# Altium project GIGA R1 WiFi.PrjPcb (part 2 of 2)

## Sheet HEADERS.SchDoc: HEADERS
size A3; Author: Silvio Navaretti; CompanyName: Arduino srl; DocumentNumber: ABX00063; Revision: V1.2; SheetNumber: 2; SheetTotal: 8; RevAuthor: Silvio Navaretti
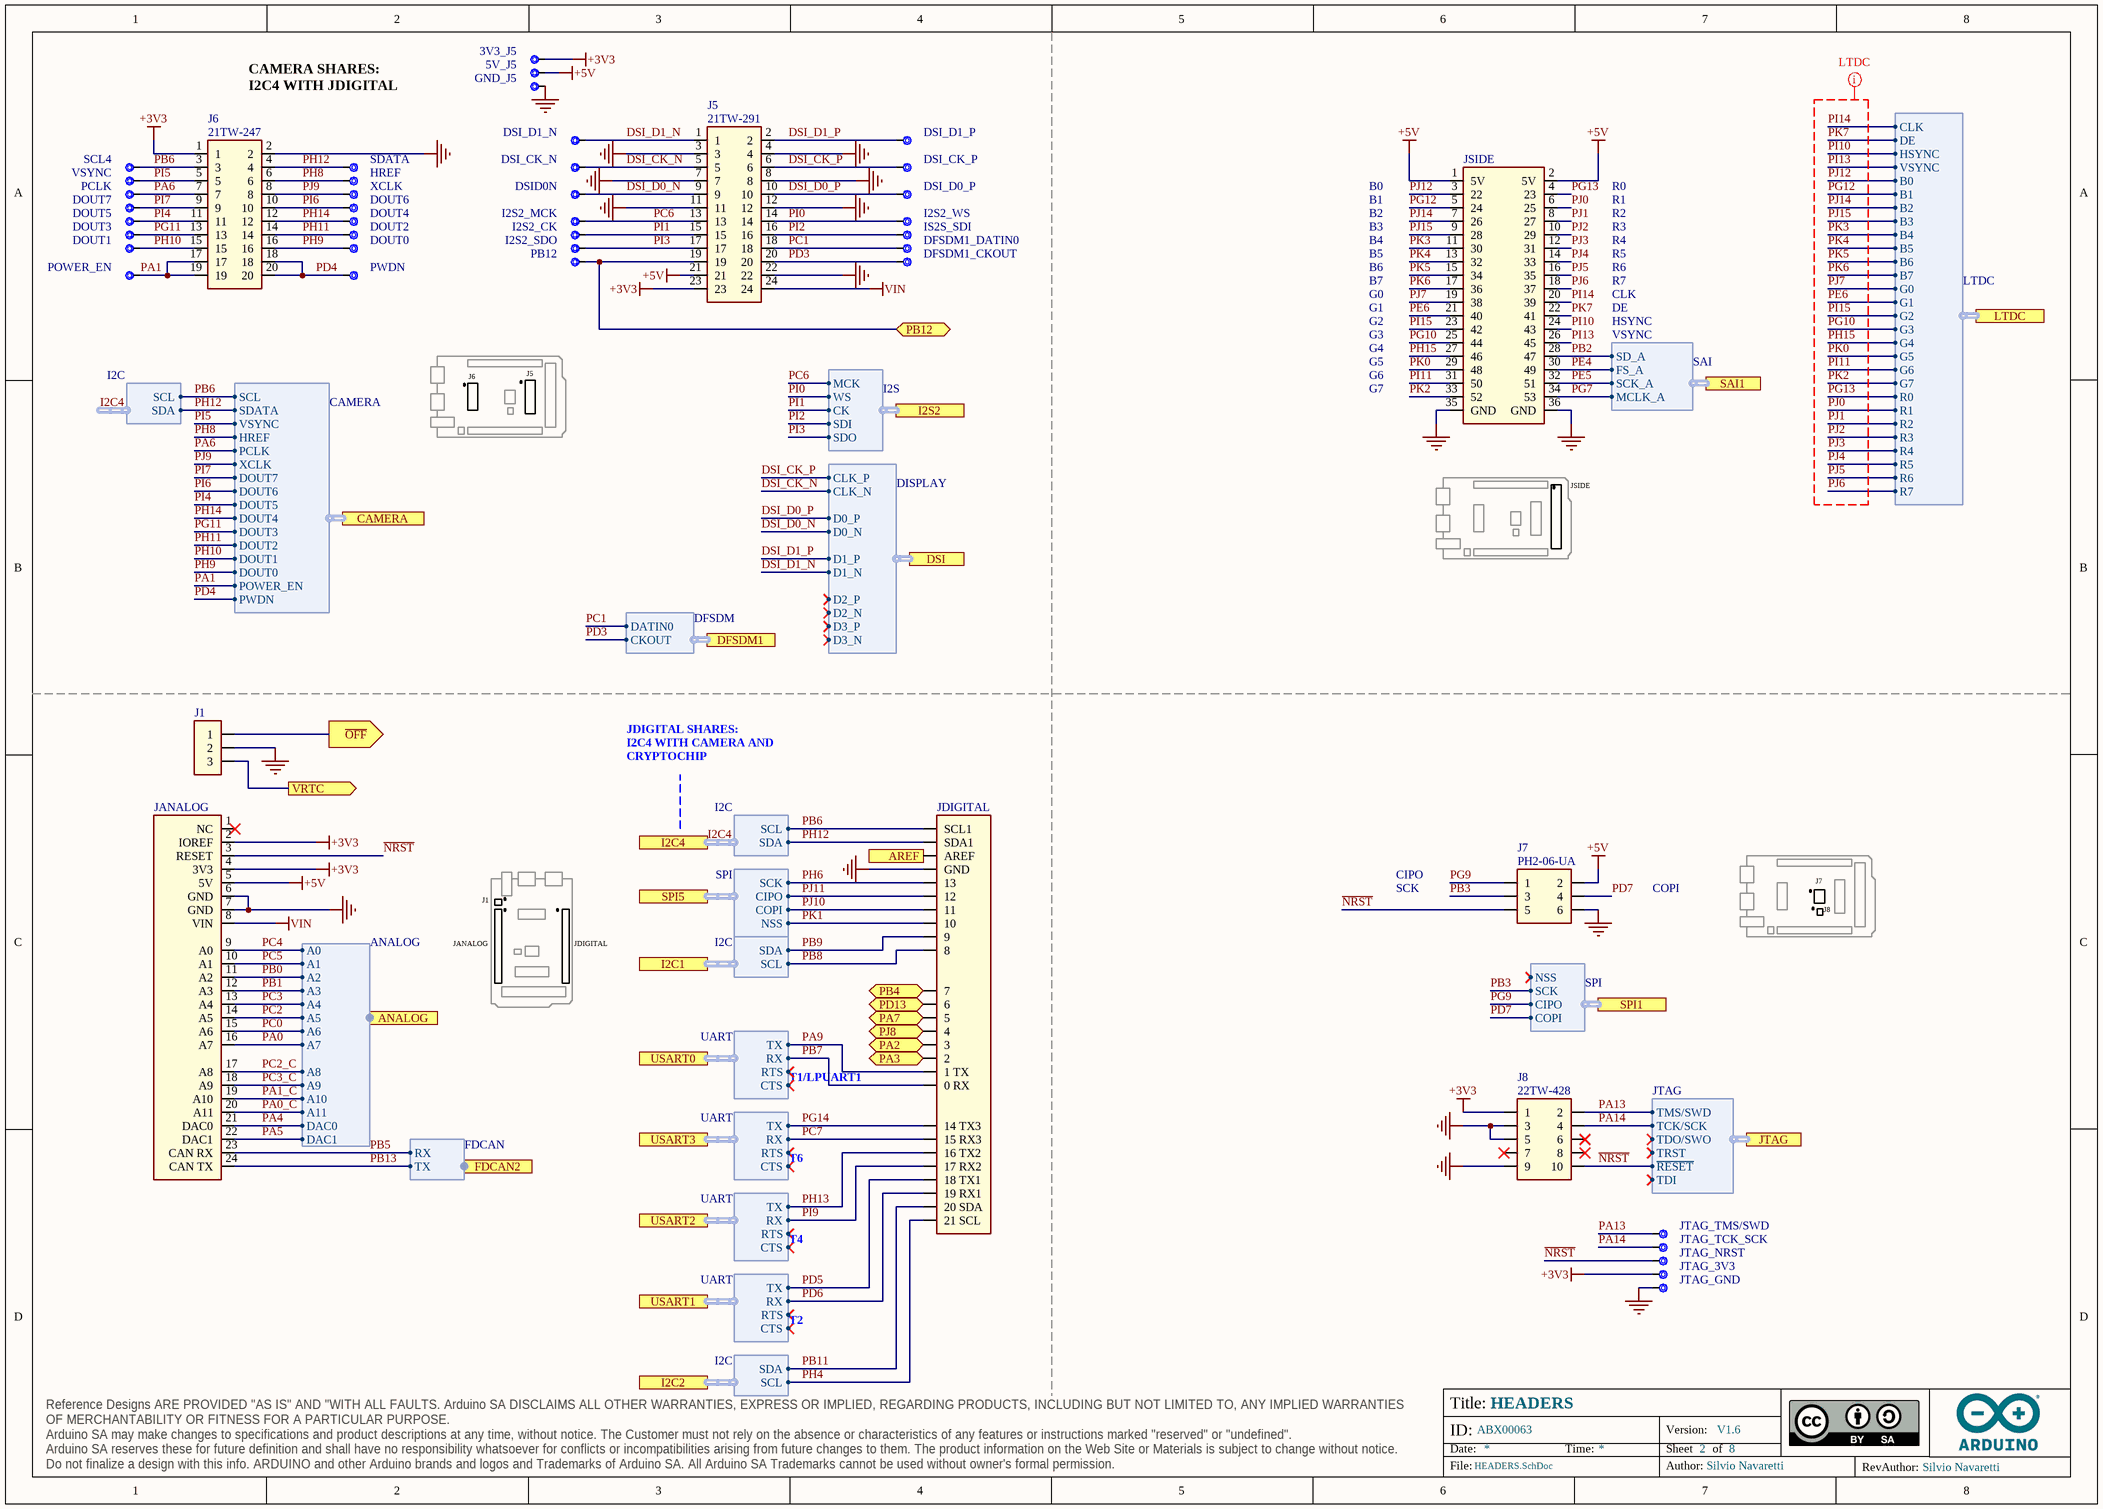
[diagram p5: HEADERS.SchDoc]

### Parts
3V3_J5  CMP-018-0005-A.3  [TP-1.00MM]  (value not drawn)  (no BOM)
5V_J5  CMP-018-0005-A.3  [TP-1.00MM]  (value not drawn)  (no BOM)
DFSDM1_CKOUT  CMP-018-0005-A.3  [TP-1.00MM]  (value not drawn)  (no BOM)
DFSDM1_DATIN0  CMP-018-0005-A.3  [TP-1.00MM]  (value not drawn)  (no BOM)
DOUT0  CMP-018-0005-A.3  [TP-1.00MM]  (value not drawn)  (no BOM)
DOUT1  CMP-018-0005-A.3  [TP-1.00MM]  (value not drawn)  (no BOM)
DOUT2  CMP-018-0005-A.3  [TP-1.00MM]  (value not drawn)  (no BOM)
DOUT3  CMP-018-0005-A.3  [TP-1.00MM]  (value not drawn)  (no BOM)
DOUT4  CMP-018-0005-A.3  [TP-1.00MM]  (value not drawn)  (no BOM)
DOUT5  CMP-018-0005-A.3  [TP-1.00MM]  (value not drawn)  (no BOM)
DOUT6  CMP-018-0005-A.3  [TP-1.00MM]  (value not drawn)  (no BOM)
DOUT7  CMP-018-0005-A.3  [TP-1.00MM]  (value not drawn)  (no BOM)
DSI_CK_N  CMP-018-0005-A.3  [TP-1.00MM]  (value not drawn)  (no BOM)
DSI_CK_P  CMP-018-0005-A.3  [TP-1.00MM]  (value not drawn)  (no BOM)
DSI_D0_P  CMP-018-0005-A.3  [TP-1.00MM]  (value not drawn)  (no BOM)
DSI_D1_N  CMP-018-0005-A.3  [TP-1.00MM]  (value not drawn)  (no BOM)
DSI_D1_P  CMP-018-0005-A.3  [TP-1.00MM]  (value not drawn)  (no BOM)
DSID0N  CMP-018-0005-A.3  [TP-1.00MM]  (value not drawn)  (no BOM)
GND_J5  CMP-018-0005-A.3  [TP-1.00MM]  (value not drawn)  (no BOM)
HREF  CMP-018-0005-A.3  [TP-1.00MM]  (value not drawn)  (no BOM)
I2S2_CK  CMP-018-0005-A.3  [TP-1.00MM]  (value not drawn)  (no BOM)
I2S2_MCK  CMP-018-0005-A.3  [TP-1.00MM]  (value not drawn)  (no BOM)
I2S2_SDO  CMP-018-0005-A.3  [TP-1.00MM]  (value not drawn)  (no BOM)
I2S2_WS  CMP-018-0005-A.3  [TP-1.00MM]  (value not drawn)  (no BOM)
IS2S_SDI  CMP-018-0005-A.3  [TP-1.00MM]  (value not drawn)  (no BOM)
J1  HEADER TH 2.54mm VERT. 1x003POS  [PIN HEADER 2.54mm VERT. 1x3POS]  (value not drawn)  (no BOM)
J5  21TW-291  [21TW-291]
J6  21TW-247  [21TW-247]
J7  PH2-06-UA  [2X03]
J8  22TW-428  [FTSH-105-01-F-DV-Footprint-1]
JANALOG  20TW-887  [GIGA header custom analog]  (value not drawn)
JDIGITAL  20TW-890  [GIGA Header custom digital]  (value not drawn)
JSIDE  20TW-891  [GIGA custom header side-Footprint-1]  (value not drawn)
JTAG_3V3  CMP-018-0005-A.3  [TP-1.00MM]  (value not drawn)  (no BOM)
JTAG_GND  CMP-018-0005-A.3  [TP-1.00MM]  (value not drawn)  (no BOM)
JTAG_NRST  CMP-018-0005-A.3  [TP-1.00MM]  (value not drawn)  (no BOM)
JTAG_TCK_SCK  CMP-018-0005-A.3  [TP-1.00MM]  (value not drawn)  (no BOM)
JTAG_TMS/SWD  CMP-018-0005-A.3  [TP-1.00MM]  (value not drawn)  (no BOM)
PB12  CMP-018-0005-A.3  [TP-1.00MM]  (value not drawn)  (no BOM)
PCLK  CMP-018-0005-A.3  [TP-1.00MM]  (value not drawn)  (no BOM)
POWER_EN  CMP-018-0005-A.3  [TP-1.00MM]  (value not drawn)  (no BOM)
PWDN  CMP-018-0005-A.3  [TP-1.00MM]  (value not drawn)  (no BOM)
SCL4  CMP-018-0005-A.3  [TP-1.00MM]  (value not drawn)  (no BOM)
SDATA  CMP-018-0005-A.3  [TP-1.00MM]  (value not drawn)  (no BOM)
VSYNC  CMP-018-0005-A.3  [TP-1.00MM]  (value not drawn)  (no BOM)
XCLK  CMP-018-0005-A.3  [TP-1.00MM]  (value not drawn)  (no BOM)

### Ports
ANALOG (harness ANALOG), AREF (out), CAMERA (harness CAMERA), DFSDM1 (harness DFSDM), DSI (harness DISPLAY), FDCAN2 (harness FDCAN), I2C1 (harness I2C), I2C2 (harness I2C), I2C4 (harness I2C), I2S2 (harness I2S), JTAG (harness JTAG), LTDC (harness LTDC), PA2 (bidir), PA3 (bidir), PA7 (bidir), PB4 (bidir), PB12 (bidir), PD13 (bidir), PJ8 (bidir), SAI1 (harness SAI), SPI1 (harness SPI), SPI5 (harness SPI), USART0 (harness UART), USART1 (harness UART), USART2 (harness UART), USART3 (harness UART), VRTC (out), ~{OFF} (out)

### Harnesses
SPI: NSS, SCK, CIPO, COPI
I2C: SDA, SCL
LTDC: B0, B1, B2, B3, B4, B5, B6, B7, CLK, DE, G0, G1, G2, G3, G4, G5, G6, G7, HSYNC, R0, R1, R2, R3, R4, R5, R6, R7, VSYNC
SAI: SD_A, FS_A, SCK_A, MCLK_A
ANALOG: A0, A1, A2, A3, A7, A6, A5, A4, A8, A9, A10, A11, DAC0, DAC1
I2S: CK, SDI, SDO, WS, MCK
DISPLAY: CLK_N, CLK_P, D0_N, D0_P, D1_N, D1_P, D2_N, D2_P, D3_N, D3_P
DFSDM: DATIN0, CKOUT
CAMERA: SCL, SDATA, VSYNC, HREF, PCLK, XCLK, DOUT7, DOUT6, DOUT5, DOUT4, DOUT3, DOUT2, DOUT1, DOUT0, POWER_EN, PWDN
JTAG: ~{RESET}, TCK/SCK, TDI, TDO/SWO, TMS/SWD, TRST
UART: RX, TX, RTS, CTS
FDCAN: RX, TX

### Nets
+3V3: 3V3_J5.X J5.23 J6.1 J8.1 JANALOG.2(IOREF) JANALOG.4(3V3) JTAG_3V3.X
+5V: 5V_J5.X J5.21 J7.2 JANALOG.5(5V) JSIDE.1(5V) JSIDE.2(5V)
GND: GND_J5.X J1.2 J5.3 J5.4 J5.7 J5.8 J5.11 J5.12 J5.22 J6.2 J7.6 J8.3 J8.5 J8.9 JANALOG.6(GND) JANALOG.7(GND) JDIGITAL.4(GND) JSIDE.35(GND) JSIDE.36(GND) JTAG_GND.X
VIN: J5.24 JANALOG.8(VIN)
DSI_CK_N: DSI_CK_N.X J5.5 ; port DSI.CLK_N
DSI_CK_P: DSI_CK_P.X J5.6 ; port DSI.CLK_P
DSI_D0_N: DSID0N.X J5.9 ; port DSI.D0_N
DSI_D0_P: DSI_D0_P.X J5.10 ; port DSI.D0_P
DSI_D1_N: DSI_D1_N.X J5.1 ; port DSI.D1_N
DSI_D1_P: DSI_D1_P.X J5.2 ; port DSI.D1_P
~{NRST}: J7.5 J8.10 JANALOG.3(RESET) JTAG_NRST.X ; port JTAG.~{RESET}  [project net JTAG.~{RESET}]
PA0: JANALOG.16(A7) ; port ANALOG.A7  [project net MIC]
PA0_C: JANALOG.20(A11) ; port ANALOG.A11
PA1: J6.17 J6.19 POWER_EN.X ; port CAMERA.POWER_EN
PA1_C: JANALOG.19(A10) ; port ANALOG.A10
PA2: JDIGITAL.15(3) ; port PA2
PA3: JDIGITAL.16(2) ; port PA3
PA4: JANALOG.21(DAC0) ; port ANALOG.DAC0
PA5: JANALOG.22(DAC1) ; port ANALOG.DAC1  [project net LEFT]
PA6: J6.7 PCLK.X ; port CAMERA.PCLK
PA7: JDIGITAL.13(5) ; port PA7
PA9: JDIGITAL.17(1_TX) ; port USART0.TX
PA13: J8.2 JTAG_TMS/SWD.X ; port JTAG.TMS/SWD  [project net JTAG.TMS/SWD]
PA14: J8.4 JTAG_TCK_SCK.X ; port JTAG.TCK/SCK  [project net JTAG.TCK/SCK]
PB0: JANALOG.11(A2) ; port ANALOG.A2
PB1: JANALOG.12(A3) ; port ANALOG.A3
PB2: JSIDE.28(47) ; port SAI1.SD_A
PB3: J7.3 ; port SPI1.SCK
PB4: JDIGITAL.11(7) ; port PB4
PB5: JANALOG.23(CAN_RX) ; port FDCAN2.RX
PB6: J6.3 JDIGITAL.1(SCL1) SCL4.X ; port CAMERA.SCL, port I2C4.SCL  [project net I2C4.SCL]
PB7: JDIGITAL.18(0_RX) ; port USART0.RX
PB8: JDIGITAL.10(8) ; port I2C1.SCL
PB9: JDIGITAL.9 ; port I2C1.SDA
PB11: JDIGITAL.25(20_SDA) ; port I2C2.SDA
PB12: J5.19 PB12.X ; port PB12
PB13: JANALOG.24(CAN_TX) ; port FDCAN2.TX
PC0: JANALOG.15(A6) ; port ANALOG.A6
PC1: DFSDM1_DATIN0.X J5.18 ; port DFSDM1.DATIN0
PC2: JANALOG.14(A5) ; port ANALOG.A5
PC2_C: JANALOG.17(A8) ; port ANALOG.A8
PC3: JANALOG.13(A4) ; port ANALOG.A4
PC3_C: JANALOG.18(A9) ; port ANALOG.A9
PC4: JANALOG.9(A0) ; port ANALOG.A0
PC5: JANALOG.10(A1) ; port ANALOG.A1
PC6: I2S2_MCK.X J5.13 ; port I2S2.MCK
PC7: JDIGITAL.20(15_RX3) ; port USART3.RX
PD3: DFSDM1_CKOUT.X J5.20 ; port DFSDM1.CKOUT
PD4: J6.18 J6.20 PWDN.X ; port CAMERA.PWDN
PD5: JDIGITAL.23(18_TX1) ; port USART1.TX
PD6: JDIGITAL.24(19_RX1) ; port USART1.RX
PD7: J7.4 ; port SPI1.COPI
PD13: JDIGITAL.12(6) ; port PD13
PE4: JSIDE.30(49) ; port SAI1.FS_A
PE5: JSIDE.32(51) ; port SAI1.SCK_A
PE6: JSIDE.21(40) ; port LTDC.G1
PG7: JSIDE.34(53) ; port SAI1.MCLK_A
PG9: J7.1 ; port SPI1.CIPO
PG10: JSIDE.25(44) ; port LTDC.G3
PG11: DOUT3.X J6.13 ; port CAMERA.DOUT3
PG12: JSIDE.5(24) ; port LTDC.B1
PG13: JSIDE.4(23) ; port LTDC.R0
PG14: JDIGITAL.19(14_TX3) ; port USART3.TX
PH4: JDIGITAL.26(21_SCL) ; port I2C2.SCL
PH6: JDIGITAL.5(13) ; port SPI5.SCK
PH8: HREF.X J6.6 ; port CAMERA.HREF
PH9: DOUT0.X J6.16 ; port CAMERA.DOUT0
PH10: DOUT1.X J6.15 ; port CAMERA.DOUT1
PH11: DOUT2.X J6.14 ; port CAMERA.DOUT2
PH12: J6.4 JDIGITAL.2(SDA1) SDATA.X ; port CAMERA.SDATA, port I2C4.SDA  [project net I2C4.SDA]
PH13: JDIGITAL.21(16_TX2) ; port USART2.TX
PH14: DOUT4.X J6.12 ; port CAMERA.DOUT4
PH15: JSIDE.27(46) ; port LTDC.G4
PI0: I2S2_WS.X J5.14 ; port I2S2.WS
PI1: I2S2_CK.X J5.15 ; port I2S2.CK
PI2: IS2S_SDI.X J5.16 ; port I2S2.SDI
PI3: I2S2_SDO.X J5.17 ; port I2S2.SDO
PI4: DOUT5.X J6.11 ; port CAMERA.DOUT5
PI5: J6.5 VSYNC.X ; port CAMERA.VSYNC
PI6: DOUT6.X J6.10 ; port CAMERA.DOUT6
PI7: DOUT7.X J6.9 ; port CAMERA.DOUT7
PI9: JDIGITAL.22(17_RX2) ; port USART2.RX
PI10: JSIDE.24(43) ; port LTDC.HSYNC
PI11: JSIDE.31(50) ; port LTDC.G6
PI13: JSIDE.26(45) ; port LTDC.VSYNC
PI14: JSIDE.20(39) ; port LTDC.CLK
PI15: JSIDE.23(42) ; port LTDC.G2
PJ0: JSIDE.6(25) ; port LTDC.R1
PJ1: JSIDE.8(27) ; port LTDC.R2
PJ2: JSIDE.10(29) ; port LTDC.R3
PJ3: JSIDE.12(31) ; port LTDC.R4
PJ4: JSIDE.14(33) ; port LTDC.R5
PJ5: JSIDE.16(35) ; port LTDC.R6
PJ6: JSIDE.18(37) ; port LTDC.R7
PJ7: JSIDE.19(38) ; port LTDC.G0
PJ8: JDIGITAL.14(4) ; port PJ8
PJ9: J6.8 XCLK.X ; port CAMERA.XCLK
PJ10: JDIGITAL.7(11) ; port SPI5.COPI
PJ11: JDIGITAL.6(12) ; port SPI5.CIPO
PJ12: JSIDE.3(22) ; port LTDC.B0
PJ14: JSIDE.7(26) ; port LTDC.B2
PJ15: JSIDE.9(28) ; port LTDC.B3
PK0: JSIDE.29(48) ; port LTDC.G5
PK1: JDIGITAL.8(10) ; port SPI5.NSS
PK2: JSIDE.33(52) ; port LTDC.G7
PK3: JSIDE.11(30) ; port LTDC.B4
PK4: JSIDE.13(32) ; port LTDC.B5
PK5: JSIDE.15(34) ; port LTDC.B6
PK6: JSIDE.17(36) ; port LTDC.B7
PK7: JSIDE.22(41) ; port LTDC.DE
Net3V3_EN_X: J1.1 ; port ~{OFF}
NetJ1_3: J1.3 ; port VRTC
NetJDIGITAL_3: JDIGITAL.3(AREF) ; port AREF

Not connected (* = marked no-connect by the designer): J8 6* 7* 8*; JANALOG 1(NC)*

### Buses and harness runs
harness I2C4 = port I2C4

### Layout directives
net class LTDC: PE6, PG10, PG12, PG13, PH15, PI10, PI11, PI13, PI14, PI15, PJ0, PJ1, PJ2, PJ3, PJ4, PJ5, PJ6, PJ7, PJ12, PJ14, PJ15, PK0, PK2, PK3, PK4, PK5, PK6, PK7

### Notes on the sheet
- CAMERA SHARES:
  I2C4 WITH JDIGITAL
- B0
- B1
- B2
- B3
- B4
- R0
- R1
- R2
- R3
- R4
- B5
- B6
- B7
- G0
- G1
- R5
- R6
- R7
- CLK
- DE
- J6
- J5
- G2
- G3
- G4
- G5
- G6
- HSYNC
- VSYNC
- G7
- JSIDE
- JDIGITAL SHARES:
  I2C4 WITH CAMERA AND CRYPTOCHIP
- J1
- CIPO
- SCK
- COPI
- J7
- J8
- JANALOG
- JDIGITAL
- H7: USART1/LPUART1
- H7: USART6
- H7: USART4
- H7: USART2
- Title:
- ID:
- Date:
- Time:
- Version:
- Sheet
- of
- RevAuthor:
- Reference Designs ARE PROVIDED "AS IS" AND "WITH ALL FAULTS. Arduino SA DISCLAIMS ALL OTHER WARRANTIES, EXPRESS OR IMPLIED, REGARDING PRODUCTS, INCLUDING BUT NOT LIMITED TO, ANY IMPLIED WARRANTIES OF MERCHANTABILITY OR FITNESS FOR A PARTICULAR PURPOSE.
  Arduino SA may make changes to specifications and product descriptions at any time, without notice. The Customer must not rely on the absence or characteristics of any features or instructions marked "reserved" or "undefined".
  Arduino SA reserves these for future definition and shall have no responsibility whatsoever for conflicts or incompatibilities arising from future changes to them. The product information on the Web Site or Materials is subject to change without notice.
  Do not finalize a design with this info. ARDUINO and other Arduino brands and logos and Trademarks of Arduino SA. All Arduino SA Trademarks cannot be used without owner's formal permission.
- File:
- Author:

### Library data of the parts
3V3_J5 5V_J5 DFSDM1_CKOUT DFSDM1_DATIN0 DOUT0-DOUT7 DSI_CK_N DSI_CK_P DSI_D0_P DSI_D1_N DSI_D1_P DSID0N GND_J5 HREF I2S2_CK I2S2_MCK I2S2_SDO I2S2_WS IS2S_SDI JTAG_3V3 JTAG_GND JTAG_NRST JTAG_TCK_SCK JTAG_TMS/SWD PB12 PCLK POWER_EN PWDN SCL4 SDATA VSYNC XCLK = UT0013-A.4: Test point 1.00mm; Design Item ID: CMP-018-0005-A.3; Source: ut.SchLib; Pin Count: 1
J1 = J0237-A.2: MOUNT A MALE HEADER TH 2.54mm VERT. 1x003POS; Code Arduino: J0237
J5 = J0265-A.9: CONN SOCKET 2ROW 24POS VERTICAL PASS THROUGH + SMD with fixing + reel + cap for pick and place; Manufacturer: 4UCON; Connector Type: BOARD CONNECTOR; Code Arduino: J0265; Number of Contacts: 24; REACH SVHC: Yes; Termination: SMD/SMT; Part Number: 21TW-291; Mount: Board; Contact Material: Copper
J6 = J0249-A.9: CONN SOCKET 2ROW 20POS VERTICAL PASS THROUGH + SMD with fixing + pick and place cap, in reel; Manufacturer: 4UCON; Connector Type: BOARD CONNECTOR; Code Arduino: J0249; Number of Contacts: 20; REACH SVHC: Yes; Termination: SMD/SMT; Part Number: 21TW-247; Mount: Board; Contact Material: Copper
J7 = J0004-A.5: CONN Header Through Hole 6 position 0.100" (2.54mm); Manufacturer: Adam Tech; Code Arduino: 0114; Part Number: PH2-06-UA
J8 = J0089-A.11: CONN HEADER SMD 10POS 2x5 1.27MM JTAG reel, capsfor pick and place; Manufacturer: 4UCON; Code Arduino: J0089; Gender: Male; Current Rating: 1.75A; Connector Type: Male Pin; Contact Plating: Gold; Housing Material: Polymer; Contact Mating Length: 0.12inch; Packaging: Reel; Contact Material: Bronze; Pitch: 1.27mm; Mount: Surface Mount; Lead Free: Lead Free; Termination: Solder; Color: Black; Housing Color: Black; Part Number: 22TW-428; Length: 6.35mm; Depth: 3.43mm; Package Quantity: 1
JANALOG = J0313-A.5: CONN THD 24X1 CUSTOM PITCH DUE JANALOG GREY; Manufacturer: 4UCON; Number of Contacts: 24; Code Arduino: 3654; Number of Rows: 1; Part Number: 20TW-887; Number of Positions: 24; Pin Count: 24
JDIGITAL = J0262-A.10: CONN THD 1X26 CUSTOM PITCH DUE JDIGITAL GREY; Manufacturer: 4UCON; Code Arduino: 3653; Number of Positions: 26; Part Number: 20TW-890; Number of Rows: 1; Pin Count: 26; Number of Contacts: 26
JSIDE = J0315-A.4: CONN THD 18X2 36V DUE JSIDE CUSTOM GREY; Manufacturer: 4UCON; Number of Contacts: 36; Code Arduino: 3656; Number of Rows: 2; Part Number: 20TW-891; Number of Positions: 36

## Sheet Wifi.SchDoc: WIFI / BLE
size A4; Author: Silvio Navaretti; CompanyName: Arduino srl; DocumentNumber: ABX00063; Revision: V1.4; SheetNumber: 6; SheetTotal: 8; RevAuthor: Silvio Navaretti
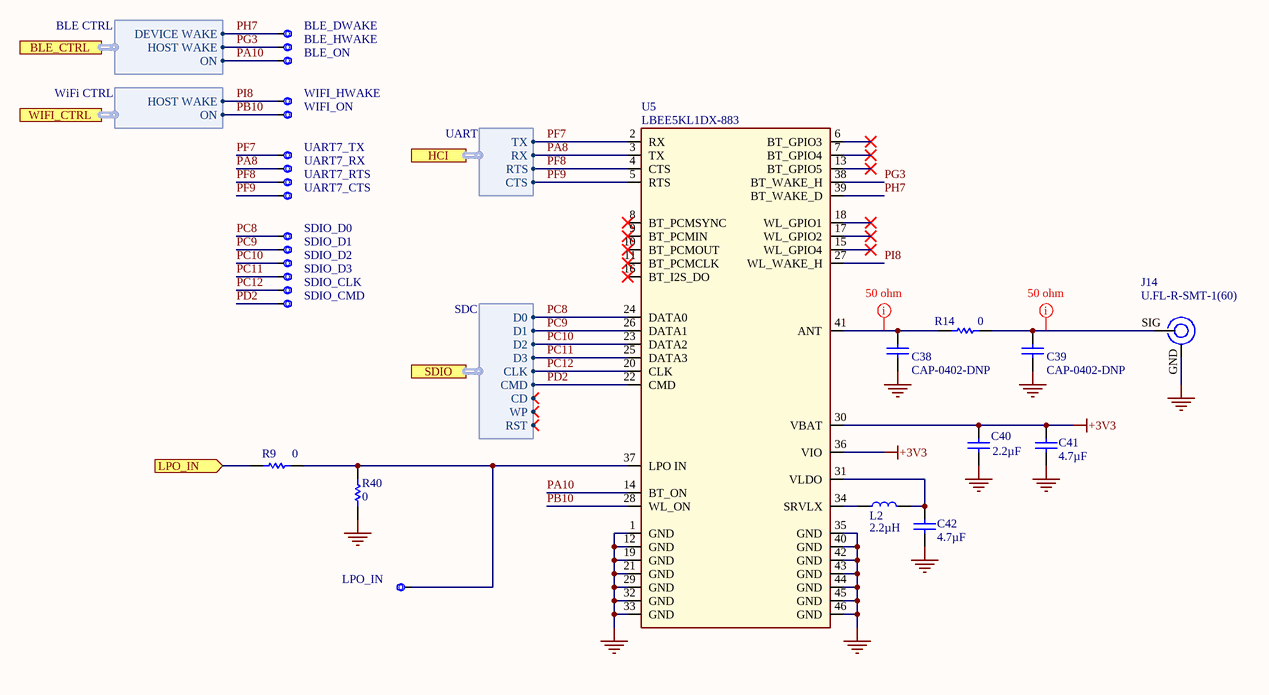
[diagram p6: Wifi.SchDoc]

### Parts
BLE_DWAKE  CMP-018-0005-A.3  [TP-1.00MM]  (value not drawn)  (no BOM)
BLE_HWAKE  CMP-018-0005-A.3  [TP-1.00MM]  (value not drawn)  (no BOM)
BLE_ON  CMP-018-0005-A.3  [TP-1.00MM]  (value not drawn)  (no BOM)
C38  CAP-0402-DNP  [CAP-0402]
C39  CAP-0402-DNP  [CAP-0402]
C40  value 2.2µF  [CAP-0402]  (hidden comment: GRM155R60J225KE95D)
C41  value 4.7µF  [CAP-0402]  (hidden comment: C1005A475M6R3NT)
C42  value 4.7µF  [CAP-0402]  (hidden comment: C1005A475M6R3NT)
J14  U.FL-R-SMT-1(60)  [U.FL-R-SMT-1(60)-1]
L2  value 2.2µH  [FP-LQM18PN_GH-IPC_C]  (hidden comment: LQM18PN2R2MGHD)
LPO_IN  CMP-018-0005-A.3  [TP-1.00MM]  (value not drawn)  (no BOM)
R9  value 0  [RES-0402]  (hidden comment: CRCW04020000Z0EDC)
R14  value 0  [RES-0402]  (hidden comment: CRCW04020000Z0EDC)
R40  value 0  [RES-0402]  (hidden comment: CRCW04020000Z0EDC)
SDIO_CLK  CMP-018-0005-A.3  [TP-1.00MM]  (value not drawn)  (no BOM)
SDIO_CMD  CMP-018-0005-A.3  [TP-1.00MM]  (value not drawn)  (no BOM)
SDIO_D0  CMP-018-0005-A.3  [TP-1.00MM]  (value not drawn)  (no BOM)
SDIO_D1  CMP-018-0005-A.3  [TP-1.00MM]  (value not drawn)  (no BOM)
SDIO_D2  CMP-018-0005-A.3  [TP-1.00MM]  (value not drawn)  (no BOM)
SDIO_D3  CMP-018-0005-A.3  [TP-1.00MM]  (value not drawn)  (no BOM)
U5  LBEE5KL1DX-883  [LBEE5KL1DX-883]
UART7_CTS  CMP-018-0005-A.3  [TP-1.00MM]  (value not drawn)  (no BOM)
UART7_RTS  CMP-018-0005-A.3  [TP-1.00MM]  (value not drawn)  (no BOM)
UART7_RX  CMP-018-0005-A.3  [TP-1.00MM]  (value not drawn)  (no BOM)
UART7_TX  CMP-018-0005-A.3  [TP-1.00MM]  (value not drawn)  (no BOM)
WIFI_HWAKE  CMP-018-0005-A.3  [TP-1.00MM]  (value not drawn)  (no BOM)
WIFI_ON  CMP-018-0005-A.3  [TP-1.00MM]  (value not drawn)  (no BOM)

### Ports
BLE_CTRL (harness BLE CTRL), HCI (harness UART), LPO_IN (in), SDIO (harness SDC), WIFI_CTRL (harness WiFi CTRL)

### Harnesses
BLE CTRL: HOST WAKE, DEVICE WAKE, ON
UART: RX, TX, RTS, CTS
WiFi CTRL: HOST WAKE, ON
SDC: CLK, CMD, D0, D1, D2, D3, CD, WP, RST

### Nets
+3V3: C40.2 C41.1 U5.30(VBAT) U5.36(VIO)
GND: C38.2 C39.2 C40.1 C41.2 C42.2 J14.GND R40.1 U5.1(GND) U5.12(GND) U5.19(GND) U5.21(GND) U5.29(GND) U5.32(GND) U5.33(GND) U5.35(GND) U5.40(GND) U5.42(GND) U5.43(GND) U5.44(GND) U5.45(GND) U5.46(GND)
MEMS_32.768kHz: R9.1 ; port LPO_IN
PA8: U5.3(TX) UART7_RX.X ; port HCI.RX
PA10: BLE_ON.X U5.14(BT_ON) ; port BLE_CTRL.ON
PB10: U5.28(WL_ON) WIFI_ON.X ; port WIFI_CTRL.ON
PC8: SDIO_D0.X U5.24(DATA0) ; port SDIO.D0
PC9: SDIO_D1.X U5.26(DATA1) ; port SDIO.D1
PC10: SDIO_D2.X U5.23(DATA2) ; port SDIO.D2
PC11: SDIO_D3.X U5.25(DATA3) ; port SDIO.D3
PC12: SDIO_CLK.X U5.20(CLK) ; port SDIO.CLK
PD2: SDIO_CMD.X U5.22(CMD) ; port SDIO.CMD
PF7: U5.2(RX) UART7_TX.X ; port HCI.TX
PF8: U5.4(CTS) UART7_RTS.X ; port HCI.RTS
PF9: U5.5(RTS) UART7_CTS.X ; port HCI.CTS
PG3: BLE_HWAKE.X U5.38(BT_WAKE_H) ; port BLE_CTRL.HOST WAKE
PH7: BLE_DWAKE.X U5.39(BT_WAKE_D) ; port BLE_CTRL.DEVICE WAKE
PI8: U5.27(WL_WAKE_H) WIFI_HWAKE.X ; port WIFI_CTRL.HOST WAKE
NetC38_1: C38.1 R14.1 U5.41(ANT)
NetC39_1: C39.1 J14.SIG R14.2
NetC42_1: C42.1 L2.2 U5.31(VLDO)
NetL2_1: L2.1 U5.34(SRVLX)
NetLPO_IN_X: LPO_IN.X R9.2 R40.2 U5.37(LPO_IN)

Not connected (* = marked no-connect by the designer): U5 6(BT_GPIO3)* 7(BT_GPIO4)* 8(BT_PCMSYNC)* 9(BT_PCMIN)* 10(BT_PCMOUT)* 11(BT_PCMCLK)* 13(BT_GPIO5)* 15(WL_GPIO4)* 16(BT_I2S_DO)* 17(WL_GPIO2)* 18(WL_GPIO1)*

### Layout directives
net class 50 ohm: NetC38_1, NetC39_1

### Notes on the sheet
- Title:
- ID:
- Date:
- Time:
- Version:
- Sheet
- of
- RevAuthor:
- Reference Designs ARE PROVIDED "AS IS" AND "WITH ALL FAULTS. Arduino SA DISCLAIMS ALL OTHER WARRANTIES, EXPRESS OR IMPLIED, REGARDING PRODUCTS, INCLUDING BUT NOT LIMITED TO, ANY IMPLIED WARRANTIES OF MERCHANTABILITY OR FITNESS FOR A PARTICULAR PURPOSE.
  Arduino SA may make changes to specifications and product descriptions at any time, without notice. The Customer must not rely on the absence or characteristics of any features or instructions marked "reserved" or "undefined". Arduino SA reserves these for future definition and shall have no responsibility whatsoever for conflicts or incompatibilities arising from future changes to them. The product information on the Web Site or Materials is subject to change without notice.
  Do not finalize a design with this info. ARDUINO and other Arduino brands and logos and Trademarks of Arduino SA. All Arduino SA Trademarks cannot be used without owner's formal permission.
- File:
- Author:

### Library data of the parts
BLE_DWAKE BLE_HWAKE BLE_ON LPO_IN SDIO_CLK SDIO_CMD SDIO_D0-SDIO_D3 UART7_CTS UART7_RTS UART7_RX UART7_TX WIFI_HWAKE WIFI_ON = UT0013-A.4: Test point 1.00mm; Design Item ID: CMP-018-0005-A.3; Source: ut.SchLib; Pin Count: 1
C38 C39 = UT0021-A.3: DNP CAP 0402; Package: 0402; Part Number: DNP
C40 = C0031-A.14: CAP CHIP 0402 2.2uF 10% 6.3V X5R; Manufacturer: Murata; Code Arduino: A5529; Voltage: 6.3V; Part Number: GRM155R60J225KE95D; Dielectric: X5R; Case Code (Imperial): 0402; Tolerance: 10%; Technology: Ceramic
C41 C42 = C0037-A.14: CAP CHIP 0402 4.7uF 20% 6V3 X5R; Manufacturer: Hottech; Code Arduino: 0833; Voltage: 6.3V; Manufacturer 2: Samsung Electro-Mechanics; Dielectric: X5R; Part Number: C1005A475M6R3NT; Tolerance: 20%; Case Code (Imperial): 0402; Technology: Ceramic; Manufacturer 3: Murata Electronics; Part number 3: GRM155R60J475ME47D; Part number 2: CL05A475KQ5NRNC
J14 = J0045-A.8: CONN Micro UFL; Manufacturer: Hirose; Code Arduino: A5364; Part Number: U.FL-R-SMT-1(60); Pin Count: 3
L2 = I0051-A.5: IND FIXED SMD 0603 2.2uH, 20%,; Manufacturer: Murata; Code Arduino: I0051; Test Frequency: 1MHz; DC Resistance (DCR): 250mR; Max Operating Temperature: 85°C; Part Number: LQM18PN2R2MGHD; Device Type: Inductor; Tolerance: 20%; Case Code (Imperial): 0603; Min Operating Temperature: -40°C; Inductance: 2.2µH
R9 R40 = R0000-A.23: RES CHIP 0402 0R 1/16W; Manufacturer: Vishay; Power: 62.5mW; Tolerance: 0%; Code Arduino: 0039; Temperature coefficient: 0ppm; Part Number: CRCW04020000Z0EDC; Case Code (Imperial): 0402; Technology: Thick film
R14 = R0000-A.23: RES CHIP 0402 0R 1/16W; Manufacturer: Vishay; Code Arduino: 0039; Tolerance: 0%; Power: 62.5mW; Temperature coefficient: 0ppm; Case Code (Imperial): 0402; Part Number: CRCW04020000Z0EDC; Technology: Thick film
U5 = U0008-A.17: MODULE WiFi 11b/g/n+BLUETOOTH 4.2 SHIELDED ULTRA SMALL LBEE5KL1DX; Manufacturer: Murata; Code Arduino: U0008; Part Number: LBEE5KL1DX-883

## Sheet CRYPTOCHIP.SchDoc: CRYPTO
size A4; Author: Silvio Navaretti; CompanyName: Arduino srl; DocumentNumber: ABX00063; Revision: V1.4; SheetNumber: 8; SheetTotal: 8; RevAuthor: Silvio Navaretti
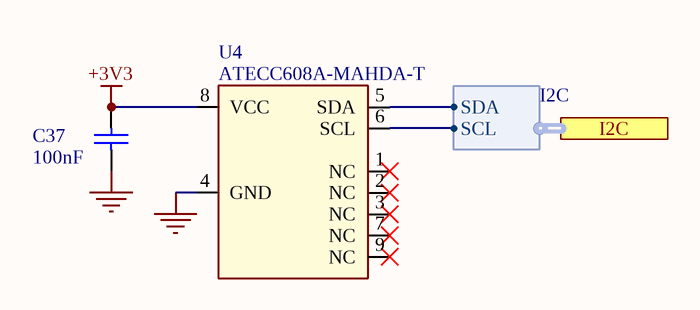
[diagram p7: CRYPTOCHIP.SchDoc]

### Parts
C37  value 100nF  [CAP-0402]  (hidden comment: GRM155R61H104KE19D)
U4  ATECC608A-MAHDA-T  [UDFN8]

### Ports
I2C (harness I2C)

### Harnesses
I2C: SDA, SCL

### Nets
+3V3: C37.2 U4.8(VCC)
GND: C37.1 U4.4(GND)
I2C4.SCL: U4.6(SCL) ; port I2C.SCL
I2C4.SDA: U4.5(SDA) ; port I2C.SDA

Not connected (* = marked no-connect by the designer): U4 1(NC)* 2(NC)* 3(NC)* 7(NC)* 9(NC)*

### Notes on the sheet
- Title:
- ID:
- Date:
- Time:
- Version:
- Sheet
- of
- RevAuthor:
- Reference Designs ARE PROVIDED "AS IS" AND "WITH ALL FAULTS. Arduino SA DISCLAIMS ALL OTHER WARRANTIES, EXPRESS OR IMPLIED, REGARDING PRODUCTS, INCLUDING BUT NOT LIMITED TO, ANY IMPLIED WARRANTIES OF MERCHANTABILITY OR FITNESS FOR A PARTICULAR PURPOSE.
  Arduino SA may make changes to specifications and product descriptions at any time, without notice. The Customer must not rely on the absence or characteristics of any features or instructions marked "reserved" or "undefined". Arduino SA reserves these for future definition and shall have no responsibility whatsoever for conflicts or incompatibilities arising from future changes to them. The product information on the Web Site or Materials is subject to change without notice.
  Do not finalize a design with this info. ARDUINO and other Arduino brands and logos and Trademarks of Arduino SA. All Arduino SA Trademarks cannot be used without owner's formal permission.
- File:
- Author:

### Library data of the parts
C37 = C0015-A.14: CAP CHIP 0402 100nF 10% 50V X5R; Manufacturer: Murata; Code Arduino: A5141; Voltage: 50V; Dielectric: X5R; Part Number: GRM155R61H104KE19D; Tolerance: 10%; Case Code (Imperial): 0402; Technology: Ceramic
U4 = U0034-A.8: IC AUTHENTICATION CHIP UDFN8; Manufacturer: Microchip; Code Arduino: U0034; Part Number: ATECC608A-MAHDA-T

## Nets that join several sheets
+3V3: TOP (DL1.A DL2.4 PB2.2), POWER (R39.2), STM32H747 (83 pins), HEADERS (7 pins), Wifi (C40.2 C41.1 U5.30 U5.36), CRYPTOCHIP (C37.2 U4.8)
+5V: POWER (6 pins), USB (D1.C U9.A1 U9.B1), HEADERS (6 pins)
GND: TOP (PB1.1 R10.1), AUDIO (C55.1 C56.1 J15.1 R23.1), POWER (19 pins), USB (16 pins), STM32H747 (111 pins), HEADERS (20 pins), Wifi (21 pins), CRYPTOCHIP (C37.1 U4.4)
VIN: POWER (5 pins), HEADERS (J5.24 JANALOG.8)
DSI_CK_N: STM32H747 (U1.L17), HEADERS (DSI_CK_N.X J5.5)
DSI_CK_P: STM32H747 (U1.L16), HEADERS (DSI_CK_P.X J5.6)
DSI_D0_N: STM32H747 (U1.M17), HEADERS (DSID0N.X J5.9)
DSI_D0_P: STM32H747 (U1.M16), HEADERS (DSI_D0_P.X J5.10)
DSI_D1_N: STM32H747 (U1.K17), HEADERS (DSI_D1_N.X J5.1)
DSI_D1_P: STM32H747 (U1.K16), HEADERS (DSI_D1_P.X J5.2)
I2C4.SCL: STM32H747 (R26.1 U1.B5), HEADERS (J6.3 JDIGITAL.1 SCL4.X), CRYPTOCHIP (U4.6)
I2C4.SDA: STM32H747 (R27.1 U1.R14), HEADERS (J6.4 JDIGITAL.2 SDATA.X), CRYPTOCHIP (U4.5)
JTAG.~{RESET}: TOP (PB1.2), STM32H747 (R21.2 U1.K1), HEADERS (J7.5 J8.10 JANALOG.3 JTAG_NRST.X)
JTAG.TCK/SCK: STM32H747 (U1.B14), HEADERS (J8.4 JTAG_TCK_SCK.X)
JTAG.TMS/SWD: STM32H747 (U1.C15), HEADERS (J8.2 JTAG_TMS/SWD.X)
LEFT: AUDIO (R25.1), STM32H747 (U1.T3), HEADERS (JANALOG.22)
MEMS_32.768kHz: STM32H747 (C72.1 R6.2 Y1.2), Wifi (R9.1)
MIC: AUDIO (C4.2 R22.1 R23.2), STM32H747 (U1.N5), HEADERS (JANALOG.16)
Net3V3_EN_X: POWER (3V3_EN.X R30.2 U6.3), HEADERS (J1.1)
NetJ1_3: STM32H747 (U1.B1), HEADERS (J1.3)
NetJDIGITAL_3: STM32H747 (R7.1 U1.M1), HEADERS (JDIGITAL.3)
PA0_C: STM32H747 (U1.T1), HEADERS (JANALOG.20)
PA1: STM32H747 (U1.N4), HEADERS (J6.17 J6.19 POWER_EN.X)
PA1_C: STM32H747 (U1.T2), HEADERS (JANALOG.19)
PA2: STM32H747 (U1.N3), HEADERS (JDIGITAL.15)
PA3: STM32H747 (U1.U2), HEADERS (JDIGITAL.16)
PA4: AUDIO (R24.1), STM32H747 (U1.U3), HEADERS (JANALOG.21)
PA6: STM32H747 (U1.R3), HEADERS (J6.7 PCLK.X)
PA7: STM32H747 (U1.R5), HEADERS (JDIGITAL.13)
PA8: STM32H747 (U1.E15), Wifi (U5.3 UART7_RX.X)
PA9: STM32H747 (U1.D15), HEADERS (JDIGITAL.17)
PA10: STM32H747 (U1.D14), Wifi (BLE_ON.X U5.14)
PA15: USB (U9.C3), STM32H747 (U1.A14)
PB0: STM32H747 (U1.U5), HEADERS (JANALOG.11)
PB1: STM32H747 (U1.T5), HEADERS (JANALOG.12)
PB2: STM32H747 (U1.R6), HEADERS (JSIDE.28)
PB3: STM32H747 (U1.C6), HEADERS (J7.3)
PB4: STM32H747 (U1.B7), HEADERS (JDIGITAL.11)
PB5: STM32H747 (U1.A5), HEADERS (JANALOG.23)
PB7: STM32H747 (U1.C5), HEADERS (JDIGITAL.18)
PB8: STM32H747 (R29.1 U1.D5), HEADERS (JDIGITAL.10)
PB9: STM32H747 (R28.1 U1.D4), HEADERS (JDIGITAL.9)
PB10: STM32H747 (U1.P11), Wifi (U5.28 WIFI_ON.X)
PB11: STM32H747 (R19.1 U1.P12), HEADERS (JDIGITAL.25)
PB12: STM32H747 (U1.T14), HEADERS (J5.19 PB12.X)
PB13: STM32H747 (U1.U14), HEADERS (JANALOG.24)
PC0: STM32H747 (U1.L2), HEADERS (JANALOG.15)
PC1: STM32H747 (U1.M2), HEADERS (DFSDM1_DATIN0.X J5.18)
PC2: STM32H747 (U1.M3), HEADERS (JANALOG.14)
PC2_C: STM32H747 (U1.R1), HEADERS (JANALOG.17)
PC3: STM32H747 (U1.M4), HEADERS (JANALOG.13)
PC3_C: STM32H747 (U1.R2), HEADERS (JANALOG.18)
PC4: STM32H747 (U1.T4), HEADERS (JANALOG.9)
PC5: STM32H747 (U1.U4), HEADERS (JANALOG.10)
PC6: STM32H747 (U1.F14), HEADERS (I2S2_MCK.X J5.13)
PC7: STM32H747 (U1.F13), HEADERS (JDIGITAL.20)
PC8: STM32H747 (U1.E13), Wifi (SDIO_D0.X U5.24)
PC9: STM32H747 (U1.E14), Wifi (SDIO_D1.X U5.26)
PC10: STM32H747 (U1.A13), Wifi (SDIO_D2.X U5.23)
PC11: STM32H747 (U1.B13), Wifi (SDIO_D3.X U5.25)
PC12: STM32H747 (U1.C12), Wifi (SDIO_CLK.X U5.20)
PC13: TOP (BOOT0/PC13.X PB2.1), STM32H747 (R4.1 U1.E3 U1.E8)
PD2: STM32H747 (U1.D12), Wifi (SDIO_CMD.X U5.22)
PD3: STM32H747 (U1.B12), HEADERS (DFSDM1_CKOUT.X J5.20)
PD4: STM32H747 (U1.A12), HEADERS (J6.18 J6.20 PWDN.X)
PD5: STM32H747 (U1.A11), HEADERS (JDIGITAL.23)
PD6: STM32H747 (U1.B11), HEADERS (JDIGITAL.24)
PD7: STM32H747 (U1.C11), HEADERS (J7.4)
PD13: STM32H747 (U1.R17), HEADERS (JDIGITAL.12)
PE3: TOP (BLUE.X R12.2), STM32H747 (U1.D3)
PE4: STM32H747 (U1.D2), HEADERS (JSIDE.30)
PE5: STM32H747 (U1.D1), HEADERS (JSIDE.32)
PE6: STM32H747 (U1.E5), HEADERS (JSIDE.21)
PF7: STM32H747 (U1.K3), Wifi (U5.2 UART7_TX.X)
PF8: STM32H747 (U1.K4), Wifi (U5.4 UART7_RTS.X)
PF9: STM32H747 (U1.L4), Wifi (U5.5 UART7_CTS.X)
PG3: STM32H747 (U1.H15), Wifi (BLE_HWAKE.X U5.38)
PG7: STM32H747 (U1.F16), HEADERS (JSIDE.34)
PG9: STM32H747 (U1.A10), HEADERS (J7.1)
PG10: STM32H747 (U1.A9), HEADERS (JSIDE.25)
PG11: STM32H747 (U1.B9), HEADERS (DOUT3.X J6.13)
PG12: STM32H747 (U1.C9), HEADERS (JSIDE.5)
PG13: STM32H747 (U1.D9), HEADERS (JSIDE.4)
PG14: STM32H747 (U1.D8), HEADERS (JDIGITAL.19)
PH4: STM32H747 (R20.1 U1.P3), HEADERS (JDIGITAL.26)
PH6: STM32H747 (U1.T11), HEADERS (JDIGITAL.5)
PH7: STM32H747 (U1.U13), Wifi (BLE_DWAKE.X U5.39)
PH8: STM32H747 (U1.T13), HEADERS (HREF.X J6.6)
PH9: STM32H747 (U1.R13), HEADERS (DOUT0.X J6.16)
PH10: STM32H747 (U1.P13), HEADERS (DOUT1.X J6.15)
PH11: STM32H747 (U1.P14), HEADERS (DOUT2.X J6.14)
PH13: STM32H747 (U1.D16), HEADERS (JDIGITAL.21)
PH14: STM32H747 (U1.B17), HEADERS (DOUT4.X J6.12)
PH15: STM32H747 (U1.B16), HEADERS (JSIDE.27)
PI0: STM32H747 (U1.A16), HEADERS (I2S2_WS.X J5.14)
PI1: STM32H747 (U1.A15), HEADERS (I2S2_CK.X J5.15)
PI2: STM32H747 (U1.B15), HEADERS (IS2S_SDI.X J5.16)
PI3: STM32H747 (U1.C14), HEADERS (I2S2_SDO.X J5.17)
PI4: STM32H747 (U1.A4), HEADERS (DOUT5.X J6.11)
PI5: STM32H747 (U1.A3), HEADERS (J6.5 VSYNC.X)
PI6: STM32H747 (U1.A2), HEADERS (DOUT6.X J6.10)
PI7: STM32H747 (U1.B3), HEADERS (DOUT7.X J6.9)
PI8: STM32H747 (U1.E4), Wifi (U5.27 WIFI_HWAKE.X)
PI9: STM32H747 (U1.E2), HEADERS (JDIGITAL.22)
PI10: STM32H747 (U1.F3), HEADERS (JSIDE.24)
PI11: STM32H747 (U1.F4), HEADERS (JSIDE.31)
PI12: TOP (R11.2 RED.X), STM32H747 (U1.H1)
PI13: STM32H747 (U1.H2), HEADERS (JSIDE.26)
PI14: STM32H747 (U1.H3), HEADERS (JSIDE.20)
PI15: STM32H747 (U1.P5), HEADERS (JSIDE.23)
PJ0: STM32H747 (U1.N6), HEADERS (JSIDE.6)
PJ1: STM32H747 (U1.P6), HEADERS (JSIDE.8)
PJ2: STM32H747 (U1.T6), HEADERS (JSIDE.10)
PJ3: STM32H747 (U1.U6), HEADERS (JSIDE.12)
PJ4: STM32H747 (U1.U7), HEADERS (JSIDE.14)
PJ5: STM32H747 (U1.R12), HEADERS (JSIDE.16)
PJ6: STM32H747 (U1.N15), HEADERS (JSIDE.18)
PJ7: STM32H747 (U1.N14), HEADERS (JSIDE.19)
PJ8: STM32H747 (U1.N13), HEADERS (JDIGITAL.14)
PJ9: STM32H747 (U1.M14), HEADERS (J6.8 XCLK.X)
PJ10: STM32H747 (U1.L14), HEADERS (JDIGITAL.7)
PJ11: STM32H747 (U1.K14), HEADERS (JDIGITAL.6)
PJ12: STM32H747 (U1.D11), HEADERS (JSIDE.3)
PJ13: TOP (GREEN.X R13.2), STM32H747 (U1.E10)
PJ14: STM32H747 (U1.D10), HEADERS (JSIDE.7)
PJ15: STM32H747 (U1.B10), HEADERS (JSIDE.9)
PK0: STM32H747 (U1.J14), HEADERS (JSIDE.29)
PK1: STM32H747 (U1.J15), HEADERS (JDIGITAL.8)
PK2: STM32H747 (U1.H17), HEADERS (JSIDE.33)
PK3: STM32H747 (U1.C8), HEADERS (JSIDE.11)
PK4: STM32H747 (U1.B8), HEADERS (JSIDE.13)
PK5: STM32H747 (U1.A8), HEADERS (JSIDE.15)
PK6: STM32H747 (U1.C7), HEADERS (JSIDE.17)
PK7: STM32H747 (U1.D7), HEADERS (JSIDE.22)
USB0_D_N: USB (D2.3 J12.A7 J12.B7 USB0_DN.X), STM32H747 (U1.E17)
USB0_D_P: USB (D2.2 J12.A6 J12.B6 USB0_DP.X), STM32H747 (U1.E16)
USB1_D_N: USB (D4.3 J2.2 USB1_DN.X), STM32H747 (U1.U15)
USB1_D_P: USB (D4.2 J2.3 USB1_DP.X), STM32H747 (U1.T15)

## Assembly variants
ABX00063 GIGA WiFi R1: not fitted C4 C12 C13 C14 C15 C16 C17 C21 C22 C23 C24 C25 C26 C30 C31 C38 C39 C51 C52 C53 C54 C55 C56 C57 C72 R6 R9 R23 R28 R29 R36 Y1